# Altium schematic sheet Top_Sheet.SchDoc: =Projectname
size A4; SheetNumber: 1; SheetTotal: 4
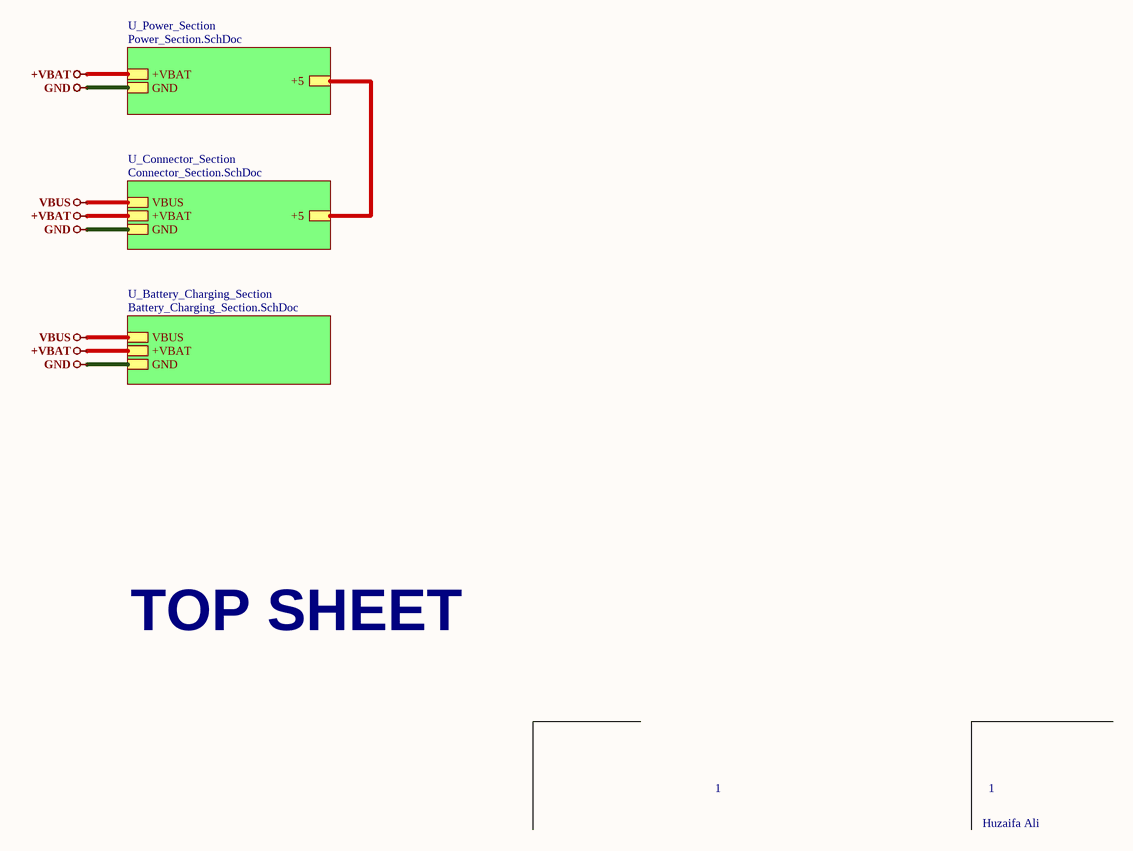
[diagram p0: Top_Sheet.SchDoc]

## Sub-sheets
U_Battery_Charging_Section = Battery_Charging_Section.SchDoc: GND, VBUS, +VBAT
U_Connector_Section = Connector_Section.SchDoc: GND, +5, VBUS, +VBAT
U_Power_Section = Power_Section.SchDoc: +VBAT, GND, +5

## Nets
+VBAT: sheet U_Power_Section/+VBAT, sheet U_Connector_Section/+VBAT, sheet U_Battery_Charging_Section/+VBAT
GND: sheet U_Power_Section/GND, sheet U_Connector_Section/GND, sheet U_Battery_Charging_Section/GND
VBUS: sheet U_Connector_Section/VBUS, sheet U_Battery_Charging_Section/VBUS
(unnamed): sheet U_Power_Section/+5, sheet U_Connector_Section/+5

## Notes on the sheet
- TOP SHEET
- 1
- Huzaifa Ali